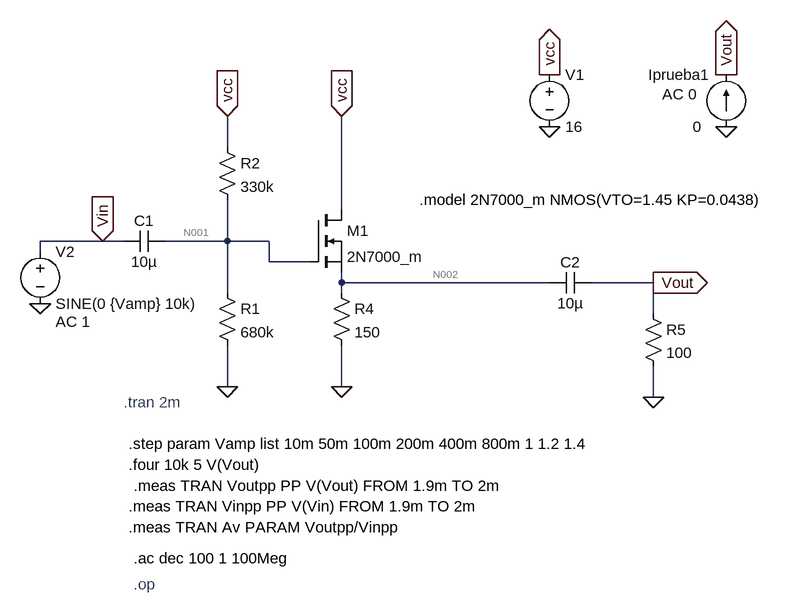
[diagram p0: schematic ampli drain comun.asc]
ampli drain comun.asc, the LTspice schematic file:
Version 4.1
SHEET 1 924 800
WIRE 48 112 48 64
WIRE 224 208 224 64
WIRE -144 256 -240 256
WIRE -112 256 -144 256
WIRE 48 256 48 192
WIRE 48 256 -48 256
WIRE 112 256 48 256
WIRE -240 272 -240 256
WIRE 112 288 112 256
WIRE 176 288 112 288
WIRE 224 320 224 304
WIRE 544 320 224 320
WIRE 704 320 608 320
WIRE 48 336 48 256
WIRE 224 336 224 320
WIRE 704 368 704 320
WIRE 48 480 48 416
WIRE 224 480 224 416
WIRE 704 496 704 448
FLAG 544 0 vcc
IOPIN 544 0 Out
FLAG 544 80 0
FLAG 48 480 0
FLAG 224 480 0
FLAG 224 64 vcc
IOPIN 224 64 In
FLAG 48 64 vcc
IOPIN 48 64 In
FLAG 704 496 0
FLAG -240 352 0
FLAG 704 320 Vout
IOPIN 704 320 Out
FLAG -144 256 Vin
IOPIN -144 256 In
FLAG 816 80 0
FLAG 816 0 Vout
IOPIN 816 0 Out
SYMBOL voltage 544 -16 R0
WINDOW 123 0 0 Left 0
WINDOW 39 0 0 Left 0
SYMATTR InstName V1
SYMATTR Value 16
SYMBOL cap -48 240 R90
WINDOW 0 0 32 VBottom 2
WINDOW 3 32 32 VTop 2
SYMATTR InstName C1
SYMATTR Value 10µ
SYMBOL res 32 320 R0
SYMATTR InstName R1
SYMATTR Value 680k
SYMBOL res 32 96 R0
SYMATTR InstName R2
SYMATTR Value 330k
SYMBOL res 208 320 R0
SYMATTR InstName R4
SYMATTR Value 150
SYMBOL cap 544 304 M90
WINDOW 0 0 32 VBottom 2
WINDOW 3 32 32 VTop 2
SYMATTR InstName C2
SYMATTR Value 10µ
SYMBOL res 688 352 R0
SYMATTR InstName R5
SYMATTR Value 100
SYMBOL voltage -240 256 R0
WINDOW 123 24 124 Left 2
WINDOW 39 0 0 Left 0
SYMATTR Value2 AC 1
SYMATTR InstName V2
SYMATTR Value SINE(0 {Vamp} 10k)
SYMBOL nmos 176 208 R0
SYMATTR InstName M1
SYMATTR Value 2N7000_m
SYMBOL current 816 80 R180
WINDOW 0 24 80 Left 2
WINDOW 3 38 0 Left 2
WINDOW 123 45 50 Left 2
WINDOW 39 0 0 Left 0
SYMATTR InstName Iprueba1
SYMATTR Value 0
SYMATTR Value2 AC 0
TEXT -112 504 Left 2 ;.tran 2m
TEXT 344 192 Left 2 !.model 2N7000_m NMOS(VTO=1.45 KP=0.0438)
TEXT -104 568 Left 2 !.step param Vamp list 10m 50m 100m 200m 400m 800m 1 1.2 1.4
TEXT -104 600 Left 2 !.four 10k 5 V(Vout)
TEXT -96 632 Left 2 !.meas TRAN Voutpp PP V(Vout) FROM 1.9m TO 2m
TEXT -104 664 Left 2 !.meas TRAN Vinpp PP V(Vin) FROM 1.9m TO 2m
TEXT -104 696 Left 2 !.meas TRAN Av PARAM Voutpp/Vinpp
TEXT -96 744 Left 2 !.ac dec 100 1 100Meg
TEXT -96 784 Left 2 ;.op

The netlist it stands for:
* ampli drain comun.asc
V1 vcc 0 16
C1 N001 Vin 10µ
R1 N001 0 680k
R2 vcc N001 330k
R4 N002 0 150
C2 N002 Vout 10µ
R5 Vout 0 100
V2 Vin 0 SINE(0 {Vamp} 10k) AC 1
M1 vcc N001 N002 N002 2N7000_m
Iprueba1 0 Vout 0 AC 0
.model NMOS NMOS
.model PMOS PMOS
.lib standard.mos
* .tran 2m
.model 2N7000_m NMOS(VTO=1.45 KP=0.0438)
.step param Vamp list 10m 50m 100m 200m 400m 800m 1 1.2 1.4
.four 10k 5 V(Vout)
.meas TRAN Voutpp PP V(Vout) FROM 1.9m TO 2m
.meas TRAN Vinpp PP V(Vin) FROM 1.9m TO 2m
.meas TRAN Av PARAM Voutpp/Vinpp
.ac dec 100 1 100Meg
* .op
.backanno
.end

* Results of the author's LTspice run, read from the files saved beside the schematic
* Operating Point (first step), zero values left out:
*   V(n001) = 10.77 V
*   V(n002) = 7.783 V
*   V(vcc) = 16 V
*   I(R1) = 15.84 µA
*   I(R2) = 15.84 µA
*   I(R4) = 51.89 mA
*   I(V1) = -51.9 mA
*   Ib(M1) = -8.227 pA
*   Id(M1) = 51.89 mA
*   Is(M1) = -51.89 mA
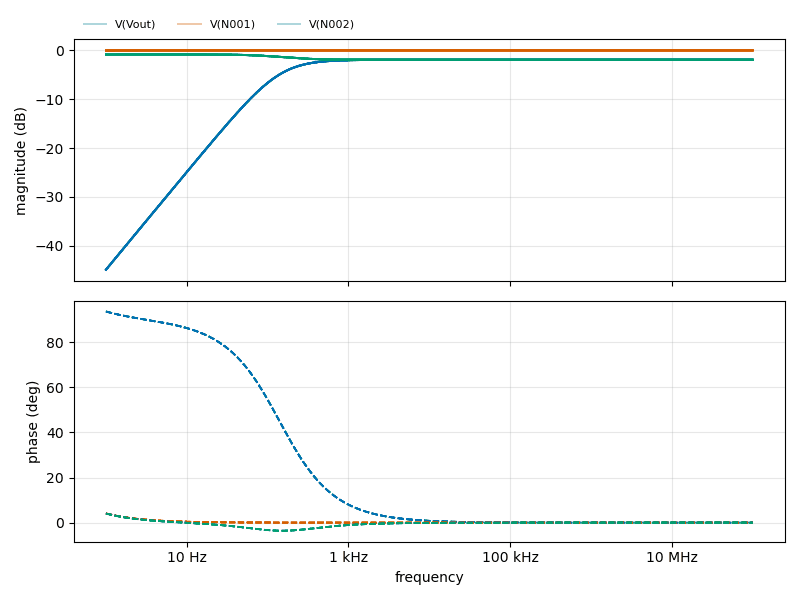
[diagram p1: AC Analysis of ampli drain comun.asc, plotted from the saved traces]
* AC Analysis, 9 runs:
*   V(Vout) [run 1]: -44.88 dB at 1 Hz, -1.92 dB at 100 MHz, peak -1.92 dB at 100 MHz, 3 dB below the peak at 140.2 Hz
*   V(Vout) [run 2]: -44.88 dB at 1 Hz, -1.92 dB at 100 MHz, peak -1.92 dB at 100 MHz, 3 dB below the peak at 140.2 Hz
*   V(Vout) [run 3]: -44.88 dB at 1 Hz, -1.92 dB at 100 MHz, peak -1.92 dB at 100 MHz, 3 dB below the peak at 140.2 Hz
*   V(Vout) [run 4]: -44.88 dB at 1 Hz, -1.92 dB at 100 MHz, peak -1.92 dB at 100 MHz, 3 dB below the peak at 140.2 Hz
*   V(Vout) [run 5]: -44.88 dB at 1 Hz, -1.92 dB at 100 MHz, peak -1.92 dB at 100 MHz, 3 dB below the peak at 140.2 Hz
*   V(Vout) [run 6]: -44.88 dB at 1 Hz, -1.92 dB at 100 MHz, peak -1.92 dB at 100 MHz, 3 dB below the peak at 140.2 Hz
*   V(Vout) [run 7]: -44.88 dB at 1 Hz, -1.92 dB at 100 MHz, peak -1.92 dB at 100 MHz, 3 dB below the peak at 140.2 Hz
*   V(Vout) [run 8]: -44.88 dB at 1 Hz, -1.92 dB at 100 MHz, peak -1.92 dB at 100 MHz, 3 dB below the peak at 140.2 Hz
*   V(N001) [run 1]: -0.02 dB at 1 Hz, 0.00 dB at 100 MHz, peak 0.00 dB at 4.467 MHz
*   V(N001) [run 2]: -0.02 dB at 1 Hz, 0.00 dB at 100 MHz, peak 0.00 dB at 4.467 MHz
*   V(N001) [run 3]: -0.02 dB at 1 Hz, 0.00 dB at 100 MHz, peak 0.00 dB at 4.467 MHz
*   V(N001) [run 4]: -0.02 dB at 1 Hz, 0.00 dB at 100 MHz, peak 0.00 dB at 4.467 MHz
*   V(N001) [run 5]: -0.02 dB at 1 Hz, 0.00 dB at 100 MHz, peak 0.00 dB at 4.467 MHz
*   V(N001) [run 6]: -0.02 dB at 1 Hz, 0.00 dB at 100 MHz, peak 0.00 dB at 4.467 MHz
*   V(N001) [run 7]: -0.02 dB at 1 Hz, 0.00 dB at 100 MHz, peak 0.00 dB at 4.467 MHz
*   V(N001) [run 8]: -0.02 dB at 1 Hz, 0.00 dB at 100 MHz, peak 0.00 dB at 4.467 MHz
*   V(N002) [run 1]: -0.84 dB at 1 Hz, -1.92 dB at 100 MHz, peak -0.82 dB at 4.571 Hz
*   V(N002) [run 2]: -0.84 dB at 1 Hz, -1.92 dB at 100 MHz, peak -0.82 dB at 4.571 Hz
*   V(N002) [run 3]: -0.84 dB at 1 Hz, -1.92 dB at 100 MHz, peak -0.82 dB at 4.571 Hz
*   V(N002) [run 4]: -0.84 dB at 1 Hz, -1.92 dB at 100 MHz, peak -0.82 dB at 4.571 Hz
*   V(N002) [run 5]: -0.84 dB at 1 Hz, -1.92 dB at 100 MHz, peak -0.82 dB at 4.571 Hz
*   V(N002) [run 6]: -0.84 dB at 1 Hz, -1.92 dB at 100 MHz, peak -0.82 dB at 4.571 Hz
*   V(N002) [run 7]: -0.84 dB at 1 Hz, -1.92 dB at 100 MHz, peak -0.82 dB at 4.571 Hz
*   V(N002) [run 8]: -0.84 dB at 1 Hz, -1.92 dB at 100 MHz, peak -0.82 dB at 4.571 Hz